# Altium schematic sheet 05_eMMC.SchDoc
size 594 x 420 mm; SheetNumber: 5; SheetTotal: 5
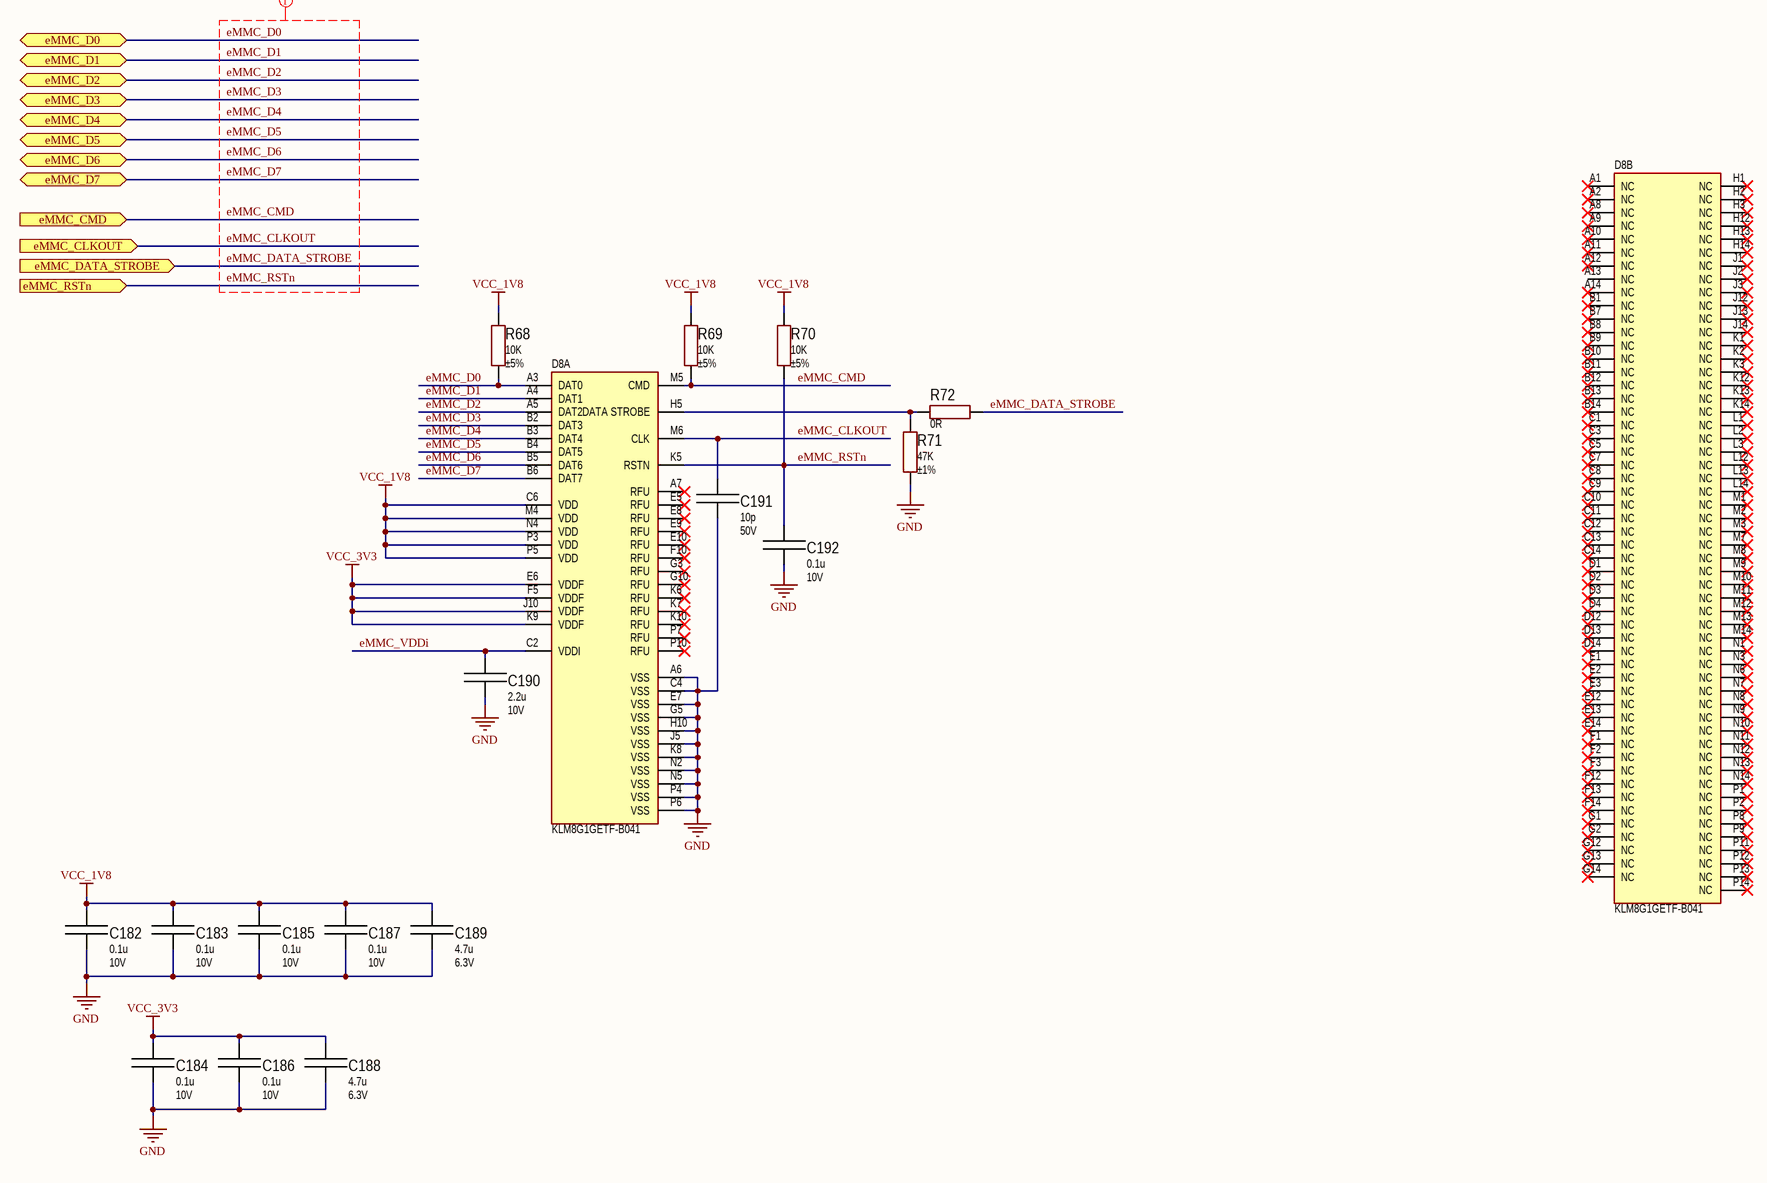
[diagram p0: 05_eMMC.SchDoc]

## Parts
C182  value 0.1u  Voltage: 10V  [CAPC1005X06N]  (hidden comment: C1005X5R1A104K050BA)
C183  value 0.1u  Voltage: 10V  [CAPC1005X06N]  (hidden comment: C1005X5R1A104K050BA)
C184  value 0.1u  Voltage: 10V  [CAPC1005X06N]  (hidden comment: C1005X5R1A104K050BA)
C185  value 0.1u  Voltage: 10V  [CAPC1005X06N]  (hidden comment: C1005X5R1A104K050BA)
C186  value 0.1u  Voltage: 10V  [CAPC1005X06N]  (hidden comment: C1005X5R1A104K050BA)
C187  value 0.1u  Voltage: 10V  [CAPC1005X06N]  (hidden comment: C1005X5R1A104K050BA)
C188  value 4.7u  Voltage: 6.3V  [CAPC1005X06N]  (hidden comment: C1005X5R0J475K050BC)
C189  value 4.7u  Voltage: 6.3V  [CAPC1005X06N]  (hidden comment: C1005X5R0J475K050BC)
C190  value 2.2u  Voltage: 10V  [CAPC1005X06N]  (hidden comment: C1005X5R1A225K050BC)
C191  value 10p  Voltage: 50V  [CAPC1005X06N]  (hidden comment: C1005C0G1H100D050BA)
C192  value 0.1u  Voltage: 10V  [CAPC1005X06N]  (hidden comment: C1005X5R1A104K050BA)
D8  KLM8G1GETF-B041  [BGA196C50P14X14_1170X1300X170]  (parts A,B of 2)
R68  value 10K  Tolerance: ±5%  [RESC1005X04N]  (hidden comment: RC0402JR-0710KL)
R69  value 10K  Tolerance: ±5%  [RESC1005X04N]  (hidden comment: RC0402JR-0710KL)
R70  value 10K  Tolerance: ±5%  [RESC1005X04N]  (hidden comment: RC0402JR-0710KL)
R71  value 47K  Tolerance: ±1%  [RESC1608X05N]  (hidden comment: RC0603FR-0747KL)
R72  value 0R  [RESC1005X04N]  (hidden comment: RC0402JR-070RL)

## Ports
eMMC_CLKOUT (in), eMMC_CMD (in), eMMC_D0 (bidir), eMMC_D1 (bidir), eMMC_D2 (bidir), eMMC_D3 (bidir), eMMC_D4 (bidir), eMMC_D5 (bidir), eMMC_D6 (bidir), eMMC_D7 (bidir), eMMC_DATA_STROBE (in), eMMC_RSTn (in)

## Nets
GND: C182.1 C183.1 C184.1 C185.1 C186.1 C187.1 C188.1 C189.1 C190.1 C191.1 C192.1 D8.A6(VSS) D8.C4(VSS) D8.E7(VSS) D8.G5(VSS) D8.H10(VSS) D8.J5(VSS) D8.K8(VSS) D8.N2(VSS) D8.N5(VSS) D8.P4(VSS) D8.P6(VSS) R71.1
VCC_1V8: C182.2 C183.2 C185.2 C187.2 C189.2 D8.C6(VDD) D8.M4(VDD) D8.N4(VDD) D8.P3(VDD) D8.P5(VDD) R68.2 R69.2 R70.2
VCC_3V3: C184.2 C186.2 C188.2 D8.E6(VDDF) D8.F5(VDDF) D8.J10(VDDF) D8.K9(VDDF)
eMMC_CLKOUT: C191.2 D8.M6(CLK) ; port eMMC_CLKOUT
eMMC_CMD: D8.M5(CMD) R69.1 ; port eMMC_CMD
eMMC_D0: D8.A3(DAT0) R68.1 ; port eMMC_D0
eMMC_D1: D8.A4(DAT1) ; port eMMC_D1
eMMC_D2: D8.A5(DAT2) ; port eMMC_D2
eMMC_D3: D8.B2(DAT3) ; port eMMC_D3
eMMC_D4: D8.B3(DAT4) ; port eMMC_D4
eMMC_D5: D8.B4(DAT5) ; port eMMC_D5
eMMC_D6: D8.B5(DAT6) ; port eMMC_D6
eMMC_D7: D8.B6(DAT7) ; port eMMC_D7
eMMC_DATA_STROBE: R72.2 ; port eMMC_DATA_STROBE
eMMC_RSTn: C192.2 D8.K5(RSTN) R70.1 ; port eMMC_RSTn
eMMC_VDDi: C190.2 D8.C2(VDDI)
NetD8_H5: D8.H5(DATA_STROBE) R71.2 R72.1

Not connected (* = marked no-connect by the designer): D8 A1(NC)* A2(NC)* A7(RFU)* A8(NC)* A9(NC)* A10(NC)* A11(NC)* A12(NC)* A13(NC) A14(NC)* B1(NC)* B7(NC)* B8(NC)* B9(NC)* B10(NC)* B11(NC)* B12(NC)* B13(NC)* B14(NC)* C1(NC)* C3(NC)* C5(NC)* C7(NC)* C8(NC)* C9(NC)* C10(NC)* C11(NC)* C12(NC)* C13(NC)* C14(NC)* D1(NC)* D2(NC)* D3(NC)* D4(NC)* D12(NC)* D13(NC)* D14(NC)* E1(NC)* E2(NC)* E3(NC)* E5(RFU)* E8(RFU)* E9(RFU)* E10(RFU)* E12(NC)* E13(NC)* E14(NC)* F1(NC)* F2(NC)* F3(NC)* F10(RFU)* F12(NC)* F13(NC)* F14(NC)* G1(NC)* G2(NC)* G3(RFU)* G10(RFU)* G12(NC)* G13(NC)* G14(NC)* H1(NC)* H2(NC)* H3(NC)* H12(NC)* H13(NC)* H14(NC)* J1(NC)* J2(NC)* J3(NC)* J12(NC)* J13(NC)* J14(NC)* K1(NC)* K2(NC)* K3(NC)* K6(RFU)* K7(RFU)* K10(RFU)* K12(NC)* K13(NC)* K14(NC)* L1(NC)* L2(NC)* L3(NC)* L12(NC)* L13(NC)* L14(NC)* M1(NC)* M2(NC)* M3(NC)* M7(NC)* M8(NC)* M9(NC)* M10(NC)* M11(NC)* M12(NC)* M13(NC)* M14(NC)* N1(NC)* N3(NC)* N6(NC)* N7(NC)* N8(NC)* N9(NC)* N10(NC)* N11(NC)* N12(NC)* N13(NC)* N14(NC)* P1(NC)* P2(NC)* P7(RFU)* P8(NC)* P9(NC)* P10(RFU)* P11(NC)* P12(NC)* P13(NC)* P14(NC)*

## Layout directives
net class eMMC: eMMC_CLKOUT, eMMC_CMD, eMMC_D0, eMMC_D1, eMMC_D2, eMMC_D3, eMMC_D4, eMMC_D5, eMMC_D6, eMMC_D7, eMMC_DATA_STROBE, eMMC_RSTn

## Notes on the sheet
- DWG NO:
- REV:
- THIS DOCUMENT AND THE DATA DISCLOSED HEREIN OR
- HEREWITH IS THE PROPERTY OF ALTIUM LIMITED AND MAY
- BE FREELY DISTRIBUTED IN WHOLE. NO RIGHTS ARE
- RESERVED OR EXPRESS OR IMPLIED WARANTEE GIVEN.
- REVISION
- DESCRIPTION
- DATE
- APPROVED
- ENG:
- APPROVALS
- PROJECT
- DSN:
- CHK:
- REFERENCE DOCUMENTS
- PROJECT REVISION:
- TITLE
- DOCUMENT REVISION:
- DESIGN ITEM:
- BOM:
- FAB DWG:
- PCB DWG:
- ASSY DWG:
- SCALE:
- A2
- SIZE
- CAGE CODE
- FILE NAME
- DWG NO.
- SHEET
- OF
- REV

## Library data of the parts
C182-C187 C192 = C1005X5R1A104K050BA: Ceramic capacitor, 0.1uF, X5R, ±10%, 10V, 0402, -55...+85°C; Manufacturer: TDK; Type: Ceramic SMD; PartNumber: C1005X5R1A104K050BA; Dielectric: X5R; Tolerance: ±10%; Temperature: -55...+85°C; Package: 0402; ComponentLink1Description: Link; ComponentLink1URL: https://product.tdk.com/en/system/files/dam/doc/product/capacitor/ceramic/mlcc/catalog/mlcc_commercial_general_en.pdf; ComponentLink2Description: LocalLink; ComponentLink2URL: C:\Users\Public\Documents\Altium\datasheet\Capacitors\mlcc_commercial_general_en.pdf
C188 C189 = C1005X5R0J475K050BC: Ceramic capacitor, 4,7uF, X5R, ±10%, 6.3V, 0402, -55...+85°C; Manufacturer: TDK; Type: Ceramic SMD; PartNumber: C1005X5R0J475K050BC; Dielectric: X5R; Tolerance: ±10%; Temperature: -55...+85°C; Package: 0402; ComponentLink1Description: Link; ComponentLink1URL: https://product.tdk.com/en/system/files/dam/doc/product/capacitor/ceramic/mlcc/catalog/mlcc_commercial_general_en.pdf; ComponentLink2Description: LocalLink; ComponentLink2URL: C:\Users\Public\Documents\Altium\datasheet\Capacitors\mlcc_commercial_general_en.pdf
C190 = C1005X5R1A225K050BC: Ceramic capacitor, 2.2uF, X5R, ±10%, 10V, 0402, -55...+85°C; Manufacturer: TDK; Type: Ceramic SMD; PartNumber: C1005X5R1A225K050BC; Dielectric: X5R; Tolerance: ±10%; Temperature: -55...+85°C; Package: 0402; ComponentLink1Description: Link; ComponentLink1URL: https://product.tdk.com/en/system/files/dam/doc/product/capacitor/ceramic/mlcc/catalog/mlcc_commercial_general_en.pdf; ComponentLink2Description: LocalLink; ComponentLink2URL: C:\Users\Public\Documents\Altium\datasheet\Capacitors\mlcc_commercial_general_en.pdf
C191 = C1005C0G1H100D050BA: Ceramic capacitor, 10pF, C0G, ±5%, 50V, 0402, -55...+125°C; Manufacturer: TDK; Type: Ceramic SMD; PartNumber: C1005C0G1H100D050BA; Dielectric: C0G; Tolerance: ±5%; Temperature: -55...+125°C; Package: 0402; ComponentLink1Description: Link; ComponentLink1URL: https://product.tdk.com/en/system/files/dam/doc/product/capacitor/ceramic/mlcc/catalog/mlcc_commercial_general_en.pdf; ComponentLink2Description: LocalLink; ComponentLink2URL: C:\Users\Public\Documents\Altium\datasheet\Capacitors\mlcc_commercial_general_en.pdf
D8 = KLM8G1GETF-B041: eMMC; Manufacturer: Samsung Semiconductor; Type: eMMC; Package: 153-FBGA; Temperature: -40...+125°C; ComponentLink1Description: Link; ComponentLink1URL: https://www.lcsc.com/datasheet/lcsc_datasheet_2410121848_Samsung-KLM8G1GETF-B041_C499918.pdf; ComponentLink2Description: LocalLink; ComponentLink2URL: C:\Users\Public\Documents\Altium\Datasheet\ICs\2410121848_Samsung-KLM8G1GETF-B041_C499918.pdf; PartNumber: KLM8G1GETF-B041
R68-R70 = RC0402JR-0710KL: Resistor film, 10K, ±5%, 0402, 0.0625W, -55...+155°C; Manufacturer: Yageo; PartNumber: RC0402JR-0710KL; Type: Resistor film; Power: 0.0625W; ComponentLink1Description: Link; ComponentLink1URL: https://www.yageo.com/upload/media/product/productsearch/datasheet/rchip/PYu-RC_Group_51_RoHS_L_12.pdf; Temperature: -55...+155°C; Package: 0402; ComponentLink2Description: LocalLink; ComponentLink2URL: C:\Users\Public\Documents\Altium\Datasheet\Resistors\PYu-RC_Group_51_RoHS_L_12.pdf
R71 = RC0603FR-0747KL: Resistor film, 47K, ±1%, 0603, 0.1W, -55...+155°C; Manufacturer: Yageo; PartNumber: RC0603FR-0747KL; Type: Resistor film; Power: 0.1W; ComponentLink1Description: Link; ComponentLink1URL: https://www.yageo.com/upload/media/product/productsearch/datasheet/rchip/PYu-RC_Group_51_RoHS_L_12.pdf; Temperature: -55...+155°C; Package: 0603; ComponentLink2Description: LocalLink; ComponentLink2URL: C:\Users\Public\Documents\Altium\Datasheet\Resistors\PYu-RC_Group_51_RoHS_L_12.pdf
R72 = RC0402JR-070RL: Resistor film, 0R, 0402, -55...+155°C; Manufacturer: Yageo; PartNumber: RC0402JR-070RL; Type: Resistor film; ComponentLink1Description: Link; ComponentLink1URL: https://www.yageo.com/upload/media/product/productsearch/datasheet/rchip/PYu-RC_Group_51_RoHS_L_12.pdf; Temperature: -55...+155°C; Package: 0402; ComponentLink2Description: LocalLink; ComponentLink2URL: C:\Users\Public\Documents\Altium\Datasheet\Resistors\PYu-RC_Group_51_RoHS_L_12.pdf